# Altium schematic sheet BYTE_SPIne.SchDoc: BYTE SPIne - Jetson Interface & Power
size A4; DocumentNumber: BYTE-SPINE-01; SheetNumber: 1; SheetTotal: 3; LCSC: C6186
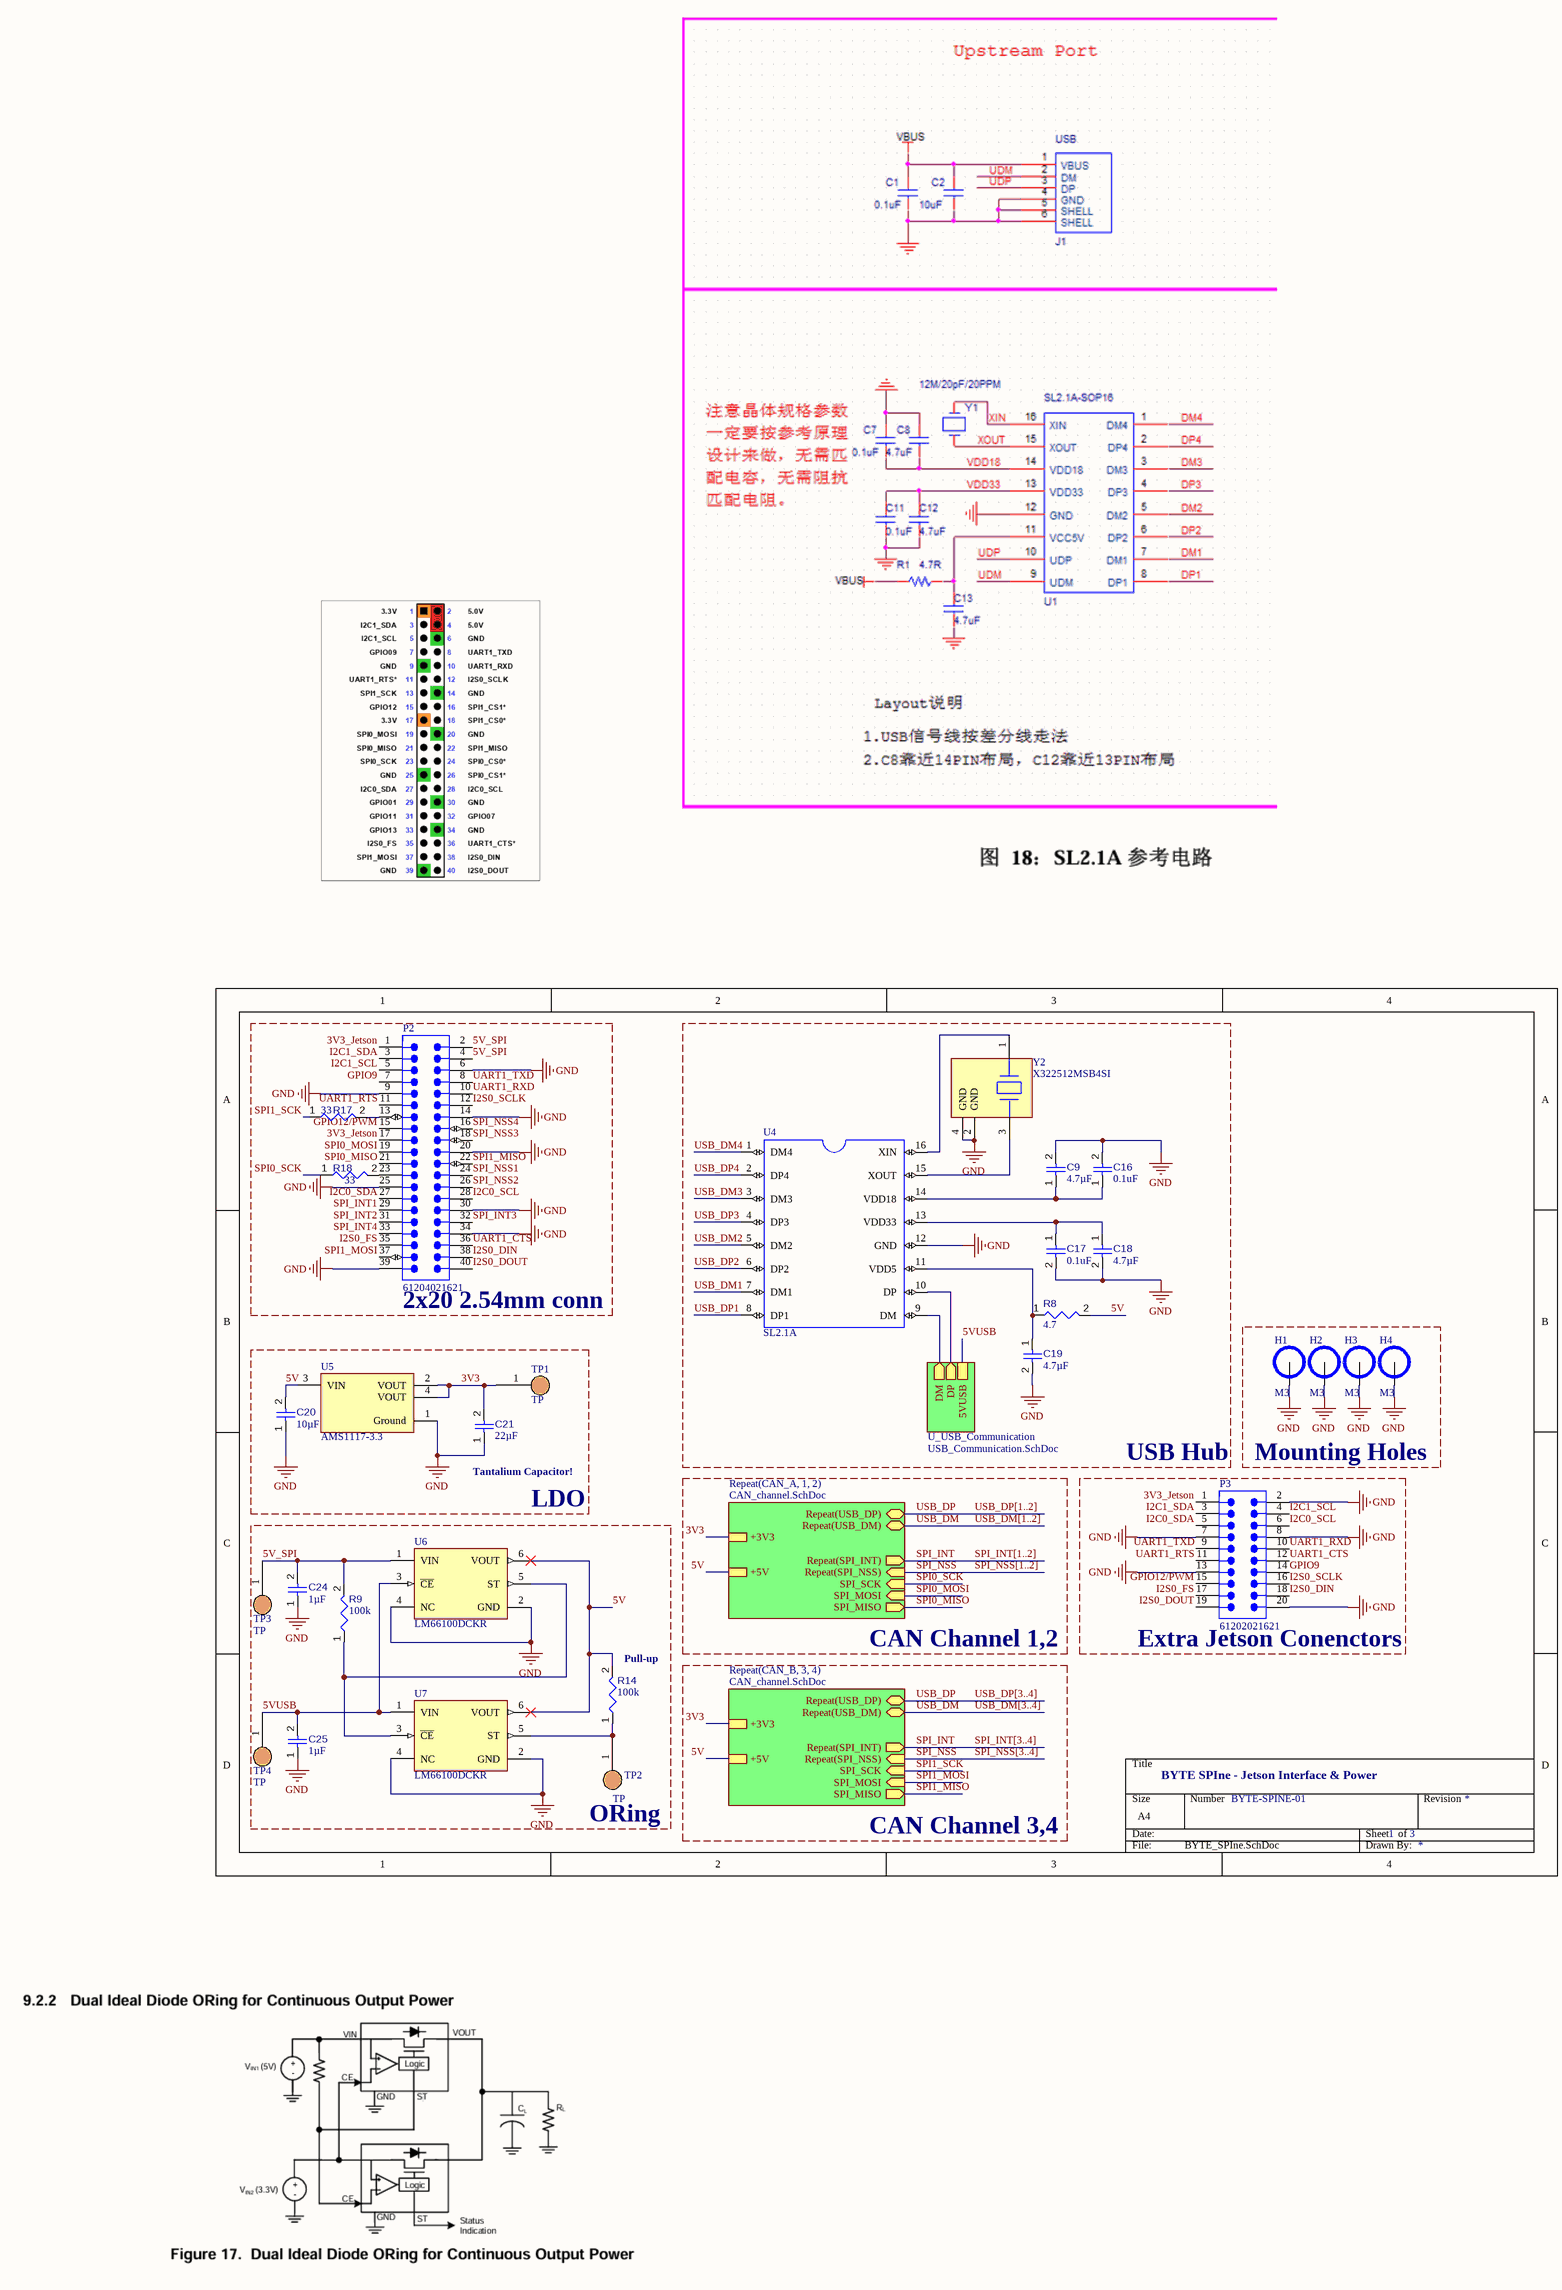
[diagram p0: BYTE_SPIne.SchDoc]

## Parts
C9  value 4.7µF  [CAPC0603(1608)100_L]  (hidden comment: 4.7uF)
C16  value 0.1uF  [CAPC0603(1608)100_L]  (hidden comment: 100nF)
C17  value 0.1uF  [CAPC0603(1608)100_L]  (hidden comment: 100nF)
C18  value 4.7µF  [CAPC0603(1608)100_L]  (hidden comment: 4.7uF)
C19  value 4.7µF  [CAPC0603(1608)100_L]  (hidden comment: 4.7uF)
C20  value 10µF  [CAPC0603(1608)100_L]  (hidden comment: 10uF)
C21  value 22µF  [CAPC0805(2012)145_L]  (hidden comment: 22uF)
C24  value 1µF  [CAPC1005X55X25LL05T10]  (hidden comment: 1uF)
C25  value 1µF  [CAPC1005X55X25LL05T10]  (hidden comment: 1uF)
H1  M3  [MH_M3_PTH]  (no BOM)
H2  M3  [MH_M3_PTH]  (no BOM)
H3  M3  [MH_M3_PTH]  (no BOM)
H4  M3  [MH_M3_PTH]  (no BOM)
P2  61204021621  [61204021621]  (no BOM)
P3  61202021621  [61202021621]  (no BOM)
R8  4.7  [RESC1608X55X25ML10T15]
R9  value 100k  [RESC0402(1005)_L]  (hidden comment: Resistor 100K +/-1 % 0402 63 mW)
R14  value 100k  [RESC0402(1005)_L]  (hidden comment: Resistor 100K +/-1 % 0402 63 mW)
R17  33  [RESC1608X55X25ML10T15]
R18  33  [RESC1608X55X25ML10T15]
TP1  TP  [TP_SMD_D1.5]  (no BOM)
TP2  TP  [TP_SMD_D1.5]  (no BOM)
TP3  TP  [TP_SMD_D1.5]  (no BOM)
TP4  TP  [TP_SMD_D1.5]  (no BOM)
U4  SL2.1A  [SO16]
U5  AMS1117-3.3  [FP-AMS1117-IPC_C]
U6  LM66100DCKR  [FP-DCK0006A-IPC_C]
U7  LM66100DCKR  [FP-DCK0006A-IPC_C]
Y2  X322512MSB4SI  [FP-ABM8-MFG]

## Blocks framed on the sheet
2x20 2.54mm conn: P2 R17 R18
USB Hub: C9 C16-C19 R8 U4 Y2
Mounting Holes: H1-H4
LDO: C20 C21 TP1 U5
ORing: C24 C25 R9 R14 TP2-TP4 U6 U7

## Sub-sheets
Repeat(CAN_A, 1, 2) = CAN_channel.SchDoc: Repeat(USB_DP) (bidir), Repeat(USB_DM) (bidir), +3V3, SPI_MISO (out), SPI_MOSI (in), SPI_SCK (in), Repeat(SPI_NSS) (in), Repeat(SPI_INT) (out), +5V
Repeat(CAN_B, 3, 4) = CAN_channel.SchDoc: Repeat(USB_DP) (bidir), Repeat(USB_DM) (bidir), +3V3, SPI_MISO (out), SPI_MOSI (in), SPI_SCK (in), Repeat(SPI_NSS) (in), Repeat(SPI_INT) (out), +5V
U_USB_Communication = USB_Communication.SchDoc: DP (out), DM (out), 5VUSB

## Nets
GND: C9.2 C16.2 C17.2 C18.2 C19.2 C20.1 C21.1 C24.1 C25.1 H1.1 H2.1 H3.1 H4.1 P2.6 P2.9 P2.14 P2.20 P2.25 P2.30 P2.34 P2.39 P3.2 P3.7 P3.8 P3.13 P3.20 U4.12(GND) U5.1(Ground) U6.2(GND) U6.4(NC) U7.2(GND) U7.4(NC) Y2.2(GND) Y2.4(GND)
3V3: C21.2 TP1.1 U5.2(VOUT) U5.4(VOUT) ; sheet Repeat(CAN_B, 3, 4)/+3V3, sheet Repeat(CAN_A, 1, 2)/+3V3
3V3_Jetson: P2.1 P2.17 P3.1
5V: C20.2 R8.2 R14.2 U5.3(VIN) U6.6(VOUT) U7.6(VOUT) ; sheet Repeat(CAN_B, 3, 4)/+5V, sheet Repeat(CAN_A, 1, 2)/+5V
5V_SPI: C24.2 P2.2 P2.4 R9.2 TP3.1 U6.1(VIN)
5VUSB: C25.2 TP4.1 U6.3(~{CE}) U7.1(VIN) ; sheet U_USB_Communication/5VUSB
GPIO9: P2.7 P3.14
GPIO12/PWM: P2.15 P3.15
I2C0_SCL: P2.28 P3.6
I2C0_SDA: P2.27 P3.5
I2C1_SCL: P2.5 P3.4
I2C1_SDA: P2.3 P3.3
I2S0_DIN: P2.38 P3.18
I2S0_DOUT: P2.40 P3.19
I2S0_FS: P2.35 P3.17
I2S0_SCLK: P2.12 P3.16
SPI0_MISO: P2.21 ; sheet Repeat(CAN_A, 1, 2)/SPI_MISO
SPI0_MOSI: P2.19 ; sheet Repeat(CAN_A, 1, 2)/SPI_MOSI
SPI0_SCK: R18.1 ; sheet Repeat(CAN_A, 1, 2)/SPI_SCK
SPI1_MISO: P2.22 ; sheet Repeat(CAN_B, 3, 4)/SPI_MISO
SPI1_MOSI: P2.37 ; sheet Repeat(CAN_B, 3, 4)/SPI_MOSI
SPI1_SCK: R17.1 ; sheet Repeat(CAN_B, 3, 4)/SPI_SCK
SPI_INT: sheet Repeat(CAN_B, 3, 4)/Repeat(SPI_INT), sheet Repeat(CAN_A, 1, 2)/Repeat(SPI_INT)
SPI_INT1: P2.29
SPI_INT2: P2.31
SPI_INT3: P2.32
SPI_INT4: P2.33
SPI_NSS: sheet Repeat(CAN_B, 3, 4)/Repeat(SPI_NSS), sheet Repeat(CAN_A, 1, 2)/Repeat(SPI_NSS)
SPI_NSS1: P2.24
SPI_NSS2: P2.26
SPI_NSS3: P2.18
SPI_NSS4: P2.16
UART1_CTS: P2.36 P3.12
UART1_RTS: P2.11 P3.11
UART1_RXD: P2.10 P3.10
UART1_TXD: P2.8 P3.9
USB_DM: sheet Repeat(CAN_B, 3, 4)/Repeat(USB_DM), sheet Repeat(CAN_A, 1, 2)/Repeat(USB_DM)
USB_DM1: U4.7(DM1)
USB_DM2: U4.5(DM2)
USB_DM3: U4.3(DM3)
USB_DM4: U4.1(DM4)
USB_DP: sheet Repeat(CAN_B, 3, 4)/Repeat(USB_DP), sheet Repeat(CAN_A, 1, 2)/Repeat(USB_DP)
USB_DP1: U4.8(DP1)
USB_DP2: U4.6(DP2)
USB_DP3: U4.4(DP3)
USB_DP4: U4.2(DP4)
NetC9_1: C9.1 C16.1 U4.14(VDD18)
NetC17_1: C17.1 C18.1 U4.13(VDD33)
NetC19_1: C19.1 R8.1 U4.11(VDD5)
NetP2_13: P2.13 R17.2
NetP2_23: P2.23 R18.2
NetR9_1: R9.1 U6.5(ST) U7.3(~{CE})
NetR14_1: R14.1 TP2.1 U7.5(ST)
NetU4_9: U4.9(DM) ; sheet U_USB_Communication/DM
NetU4_10: U4.10(DP) ; sheet U_USB_Communication/DP
NetU4_15: U4.15(XOUT) Y2.3
NetU4_16: U4.16(XIN) Y2.1

## Buses and harness runs
bus SPI_INT[1..2]
bus SPI_INT[3..4]
bus SPI_NSS[1..2]
bus SPI_NSS[3..4]
bus USB_DM[1..2]
bus USB_DM[3..4]
bus USB_DP[1..2]
bus USB_DP[3..4]

## Notes on the sheet
- (near C21) Tantalium Capacitor!
- (near R14) Pull-up
- CAN Channel 1,2
- (near P3) Extra Jetson Conenctors
- CAN Channel 3,4

## Library data of the parts
C9 C16-C19 = CMP-001-00076-4: 0603; Tolerance: 10%; Voltage Rating: 10V; Mounting Technology: SMT; Case/Package: 0603; Pins: 2; Min Operating Temperature: -55°C; Max Operating Temperature: 85°C
  C9 C18 C19: LCSC: C19666
  C16 C17: LCSC: C14663
C20 = CMP-001-00075-4: 0603; Voltage Rating: 10V; Tolerance: 10%; Max Operating Temperature: 85°C; Pins: 2; Case/Package: 0603; Mounting Technology: SMT; Min Operating Temperature: -55°C; LCSC: C19702
C21 = CMP-001-00081-4: 0805; Voltage Rating: 16V; Tolerance: 5%; Mounting Technology: SMT; Pins: 2; Max Operating Temperature: 85°C; Case/Package: 0805; Min Operating Temperature: -55°C; LCSC: C45783
C24 C25 = CMP-001-00008-6: 0402; Tolerance: 10%; Capacitor Type: Ceramic; Voltage Rating: 6.3V; Max Operating Temperature: 85°C; Mounting Technology: SM; Case/Package: 0402; RoHS Compliant: True; Min Operating Temperature: -55°C; Pins: 2; LCSC: C52923
H1-H4 = MH_M3_PTH
P2 = CMP-1502-00015-4: WR-BHD Straight Male, Box Header, Through Hole, 2 Rows, 40 Contacts, 2.54mm Pitch; Number of Positions: 40; Contact Resistance: 20mΩ; Current Rating: 3A; Connector Type: Male Pin; Operating Supply Voltage: 250V; Insulation Resistance: 1GΩ; Color: Black; Row Spacing: 2.54mm; Pitch: 2.54mm; RoHS: Compliant; Max Operating Temperature: 105°C; Insulation Material: PBT; Number of Pins: 40; Contact Plating: Gold; Orientation: Vertical; Voltage Rating: 250V; Number of Rows: 2; Lead Pitch: 2.54mm; Length: 58.46mm; Mount: Through Hole; Gender: Male; Number of Contacts: 40; Height: 9.25mm; Min Operating Temperature: -40°C; Contact Material: Gold; Termination: Solder; REACH SVHC: Unknown
P3 = CMP-1502-00010-3: WR-BHD Straight Male, Box Header, Through Hole, 2 Rows, 20 Contacts, 2.54mm Pitch; Insulation Resistance: 1GΩ; Number of Contacts: 20; Current Rating: 3A; Voltage Rating: 250V; Connector Type: Male Pin; Contact Resistance: 20mΩ; Insulation: Insulated; Mount: Through Hole; Length: 33.06mm; Min Operating Temperature: -40°C; Orientation: Vertical; Number of Rows: 2; Width: 33.06mm; Row Spacing: 2.54mm; Flammability Rating: UL94 V-0; Contact Gender: Male; Lead Pitch: 2.54mm; Housing Material: PBT; Voltage Rating (DC): 250V; Pitch: 2.54mm; Termination: Through Hole; Number of Pins: 20; RoHS: Compliant; Insulation Material: PBT; Gender: Male; Contact Material: Gold; Number of Positions: 20; Max Operating Temperature: 105°C; Operating Supply Voltage: 250V; Height: 9.25mm; Contact Plating: Gold; Color: Black
R8 = CMP-009-00031-5: 0603; Tolerance: 1%; Power: 100mW; Mounting Technology: SM; Case/Package: 0603; Value: 4.7; RoHS Compliant: True; Pins: 2; Min Operating Temperature: -55°C; Max Operating Temperature: 155°C; LCSC: C23164
R9 R14 = CMP-009-00168-3: Chip Resistor, 100 kOhms, +/-1 %, 63 mW, -55 to 155 degC, 0402; Tolerance: 1%; Power: 63mW; Max Operating Temperature: 155°C; Min Operating Temperature: -55°C; Pins: 2; Case/Package: 0402; LCSC: C25741
R17 R18 = CMP-009-00031-5: Tolerance: 1%; Power: 100mW; Mounting Technology: SM; Case/Package: 0603; Value: 33; RoHS Compliant: True; Pins: 2; Min Operating Temperature: -55°C; Max Operating Temperature: 155°C; LCSC: C23140
TP1-TP4 = TP_SMD_D1.5
U4 = SL2.1A: USB 2.0 HIGH SPEED 4-PORT HUB CONTROLLER; MF: CoreChips ShenZhen CO.,Ltd; SnapEDA_Link: https://www.snapeda.com/parts/SL2.1A/CoreChips+ShenZhen+CO.%252CLtd/view-part/?ref=snap; Package: Package; Value: *; MP: SL2.1A; Check_prices: https://www.snapeda.com/parts/SL2.1A/CoreChips+ShenZhen+CO.%252CLtd/view-part/?ref=eda; LCSC: C6798314
U5 = CMP-209535-000001-1: LDO Voltage Regulators 1A, 3.3V; Manufacturer: Advanced Monolithic Systems; Dropout Voltage: 1.1V; Output Type: Fixed; Nominal Supply Current: 5mA; Max Power Dissipation: 1.2W; Max Supply Voltage: 15V; Number Of Outputs: 1; Standoff Height: 0.64mm; Max Junction Temp: +125°C; Height: 1.8mm; Package: AMS1117; Device Class L2: Power Management ICs; ComponentLink2Description: Datasheet; ComponentLink2URL: http://www.advanced-monolithic.com/pdf/ds1117.pdf; Category: IC; RoHS: TRUE; Automotive: No; Device Class L1: Integrated Circuits (ICs); Output Current: 1A; Device Class L3: Voltage Regulators - Linear; Temperature: -40°C to +125°C; Output Voltage: 3.3V; Manufacturer Part Number: AMS1117-3.3; Temperature Range Low: -40°C; Octopart: https://octopart.com/ams1117-3.3-advanced+monolithic+systems-25899300; Lead Free: Yes; Ipc Land Pattern Name: SOT229P700X180-4; Temperature Range High: +125°C; LCSC: C6186
U6 U7 = CMP-04910-000059-1: IC OR CTRLR IDEAL DIODE SC70-6; LCSC: C2869734
Y2 = CMP-27762-003220-1: Operating Frequency: 12 MHz; Tolerance: 20ppm; Load Capacitance: 18pF; ESR (Equivalent Series Resistance): 120R; Frequency Stability: 50ppm; Frequency: 12MHz; Resistor Type: Ceramic; Frequency Tolerance: 20ppm; Packaging: Tape and Reel; Number of Pins: 4; Case/Package: CSMD; Max Operating Temperature: 70°C; Mount: Surface Mount; Package Quantity: 1000; Radiation Hardening: No; Min Operating Temperature: -20°C; Width: 0.098inch; Lead Free: Lead Free; Height: 0.031inch; Depth: 2.5mm; REACH SVHC: No SVHC; Series: ABM8; Series Resistance: 120R; Length: 3.2mm; Termination: SMD/SMT; RoHS Compliant: Yes; LCSC: C9002